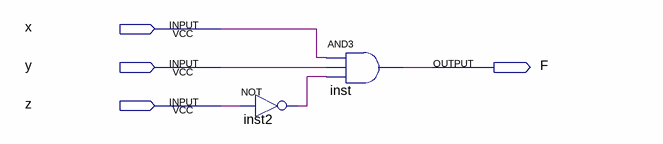
[diagram p0: schematic sheet]
// Quartus schematic project2.bdf as structural Verilog: 2 symbols, 4 pins
module project2 (
  input  x,
  input  y,
  input  z,
  output F
);

  wire inst2_out;

  not inst2 (inst2_out, z);
  and inst (F, x, y, inst2_out);
endmodule
